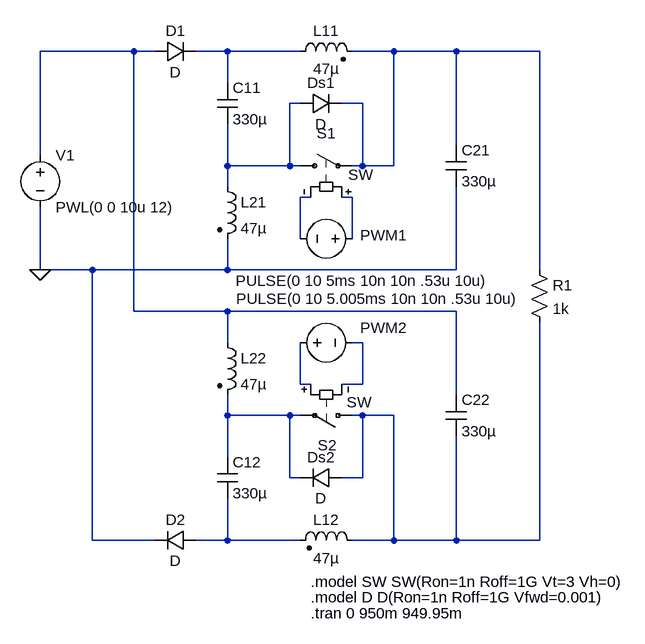
[diagram p0: schematic BC_Type3_ideal.asc]
BC_Type3_ideal.asc, the LTspice schematic file:
Version 4
SHEET 1 1156 976
WIRE 112 96 -32 96
WIRE 144 96 112 96
WIRE 256 96 208 96
WIRE 368 96 256 96
WIRE 512 96 448 96
WIRE 608 96 512 96
WIRE 736 96 608 96
WIRE 256 144 256 96
WIRE 368 176 352 176
WIRE 464 176 432 176
WIRE 608 240 608 96
WIRE -32 256 -32 96
WIRE 256 272 256 208
WIRE 352 272 352 176
WIRE 352 272 256 272
WIRE 368 272 352 272
WIRE 464 272 464 176
WIRE 464 272 448 272
WIRE 512 272 512 96
WIRE 512 272 464 272
WIRE 256 304 256 272
WIRE 384 320 368 320
WIRE 448 320 432 320
WIRE 368 384 368 320
WIRE 448 384 448 320
WIRE -32 432 -32 336
WIRE 48 432 -32 432
WIRE 256 432 256 384
WIRE 256 432 48 432
WIRE 608 432 608 304
WIRE 608 432 256 432
WIRE 736 432 736 96
WIRE 112 496 112 96
WIRE 256 496 112 496
WIRE 608 496 256 496
WIRE 256 544 256 496
WIRE 464 544 448 544
WIRE 368 608 368 544
WIRE 384 608 368 608
WIRE 464 608 464 544
WIRE 464 608 432 608
WIRE 608 624 608 496
WIRE 256 656 256 624
WIRE 352 656 256 656
WIRE 368 656 352 656
WIRE 464 656 448 656
WIRE 512 656 464 656
WIRE 256 720 256 656
WIRE 352 752 352 656
WIRE 368 752 352 752
WIRE 464 752 464 656
WIRE 464 752 432 752
WIRE 48 848 48 432
WIRE 144 848 48 848
WIRE 256 848 256 784
WIRE 256 848 208 848
WIRE 368 848 256 848
WIRE 512 848 512 656
WIRE 512 848 448 848
WIRE 608 848 608 688
WIRE 608 848 512 848
WIRE 736 848 736 512
WIRE 736 848 608 848
FLAG -32 432 0
SYMBOL cap 240 144 R0
SYMATTR InstName C11
SYMATTR Value 330µ
SYMATTR SpiceLine Rser=0
SYMBOL ind2 240 288 R0
SYMATTR InstName L21
SYMATTR Value 47µ
SYMATTR Type ind
SYMATTR SpiceLine Rser=0
SYMBOL ind2 352 112 R270
WINDOW 0 32 56 VTop 2
WINDOW 3 5 56 VBottom 2
SYMATTR InstName L11
SYMATTR Value 47µ
SYMATTR Type ind
SYMATTR SpiceLine Rser=0
SYMBOL cap 592 240 R0
SYMATTR InstName C21
SYMATTR Value 330µ
SYMATTR SpiceLine Rser=0
SYMBOL cap 240 720 R0
SYMATTR InstName C12
SYMATTR Value 330µ
SYMATTR SpiceLine Rser=0
SYMBOL ind2 240 528 R0
SYMATTR InstName L22
SYMATTR Value 47µ
SYMATTR Type ind
SYMATTR SpiceLine Rser=0
SYMBOL ind2 464 864 M270
WINDOW 0 32 56 VTop 2
WINDOW 3 4 56 VBottom 2
SYMATTR InstName L12
SYMATTR Value 47µ
SYMATTR Type ind
SYMATTR SpiceLine Rser=0
SYMBOL cap 592 624 R0
SYMATTR InstName C22
SYMATTR Value 330µ
SYMATTR SpiceLine Rser=0
SYMBOL voltage -32 240 R0
WINDOW 123 0 0 Left 0
WINDOW 39 0 0 Left 0
SYMATTR InstName V1
SYMATTR Value PWL(0 0 10u 12)
SYMBOL res 720 416 R0
SYMATTR InstName R1
SYMATTR Value 1k
SYMBOL sw 352 272 R270
WINDOW 0 50 41 VRight 2
WINDOW 3 -14 90 VRight 2
SYMATTR InstName S1
SYMBOL sw 464 656 R90
WINDOW 0 46 40 VRight 2
WINDOW 3 -20 -14 VRight 2
SYMATTR InstName S2
SYMBOL voltage 464 384 R90
WINDOW 0 10 -32 VBottom 2
WINDOW 3 49 0 VTop 2
WINDOW 123 0 0 Left 0
WINDOW 39 0 0 Left 0
SYMATTR InstName PWM1
SYMATTR Value PULSE(0 10 5ms 10n 10n .53u 10u)
SYMBOL voltage 352 544 R270
WINDOW 0 7 144 VTop 2
WINDOW 3 83 136 VBottom 2
WINDOW 123 0 0 Left 0
WINDOW 39 0 0 Left 0
SYMATTR InstName PWM2
SYMATTR Value PULSE(0 10 5.005ms 10n 10n .53u 10u)
SYMBOL diode 144 112 R270
WINDOW 0 32 32 VTop 2
WINDOW 3 0 32 VBottom 2
SYMATTR InstName D1
SYMBOL diode 208 832 R90
WINDOW 0 0 32 VBottom 2
WINDOW 3 32 32 VTop 2
SYMATTR InstName D2
SYMBOL diode 432 736 R90
WINDOW 0 0 32 VBottom 2
WINDOW 3 32 32 VTop 2
SYMATTR InstName Ds2
SYMBOL diode 368 192 R270
WINDOW 0 32 32 VTop 2
WINDOW 3 0 32 VBottom 2
SYMATTR InstName Ds1
TEXT 384 912 Left 2 !.model SW SW(Ron=1n Roff=1G Vt=3 Vh=0)
TEXT 384 960 Left 2 !.tran 0 950m 949.95m
TEXT 384 936 Left 2 !.model D D(Ron=1n Roff=1G Vfwd=0.001)

The netlist it stands for:
* BC_Type3_ideal.asc
C11 N002 N004 330µ Rser=0
L21 N004 0 47µ Rser=0
L11 N002 N003 47µ Rser=0
C21 N003 0 330µ Rser=0
C12 N009 N011 330µ Rser=0
L22 N001 N009 47µ Rser=0
L12 N010 N011 47µ Rser=0
C22 N001 N010 330µ Rser=0
V1 N001 0 PWL(0 0 10u 12)
R1 N003 N010 1k
S1 N004 N003 N006 N005 SW
S2 N010 N009 N008 N007 SW
V§PWM1 N006 N005 PULSE(0 10 5ms 10n 10n .53u 10u)
V§PWM2 N008 N007 PULSE(0 10 5.005ms 10n 10n .53u 10u)
D1 N001 N002 D
D2 N011 0 D
Ds2 N010 N009 D
Ds1 N004 N003 D
.model D D
.lib standard.dio
.model SW SW(Ron=1n Roff=1G Vt=3 Vh=0)
.tran 0 950m 949.95m
.model D D(Ron=1n Roff=1G Vfwd=0.001)
.backanno
.end